# Altium project 2026_carte_LCM.PrjPcb
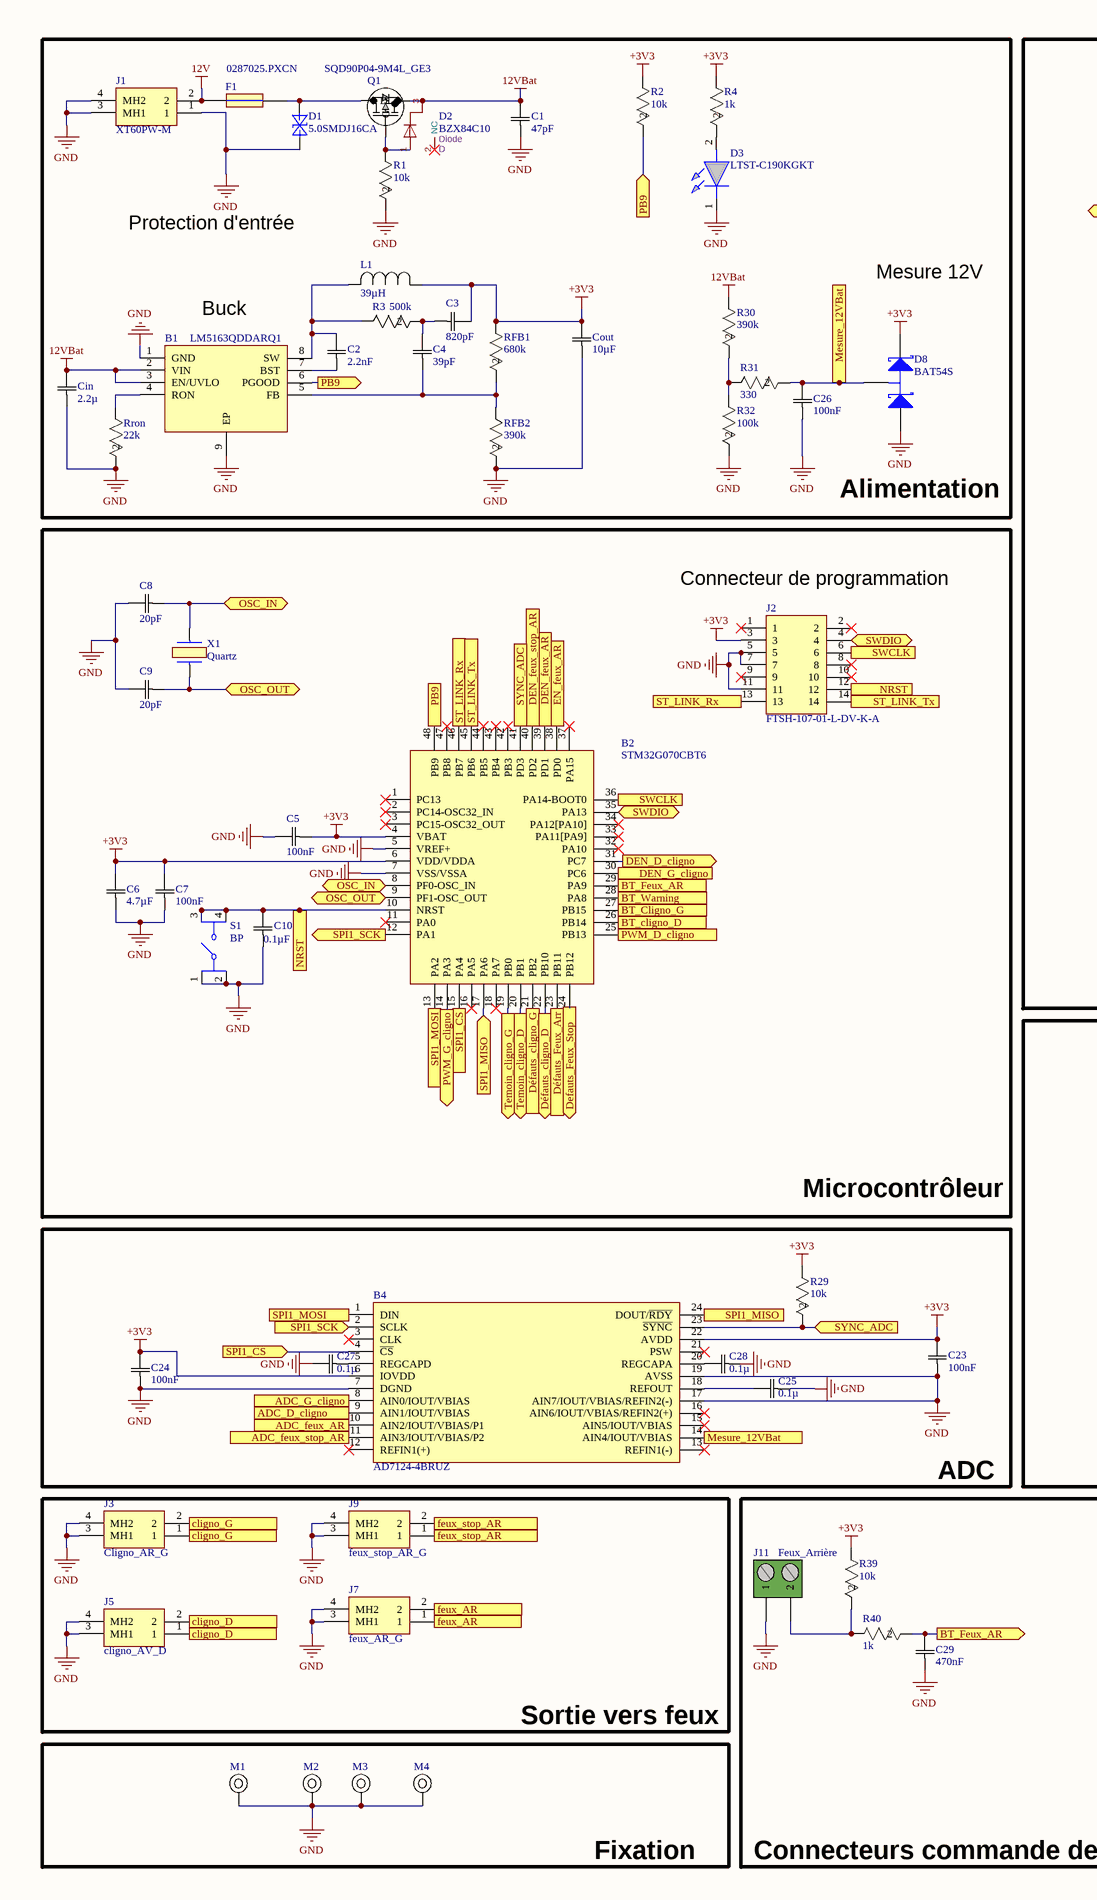
[diagram p0: LCM.SchDoc, left]
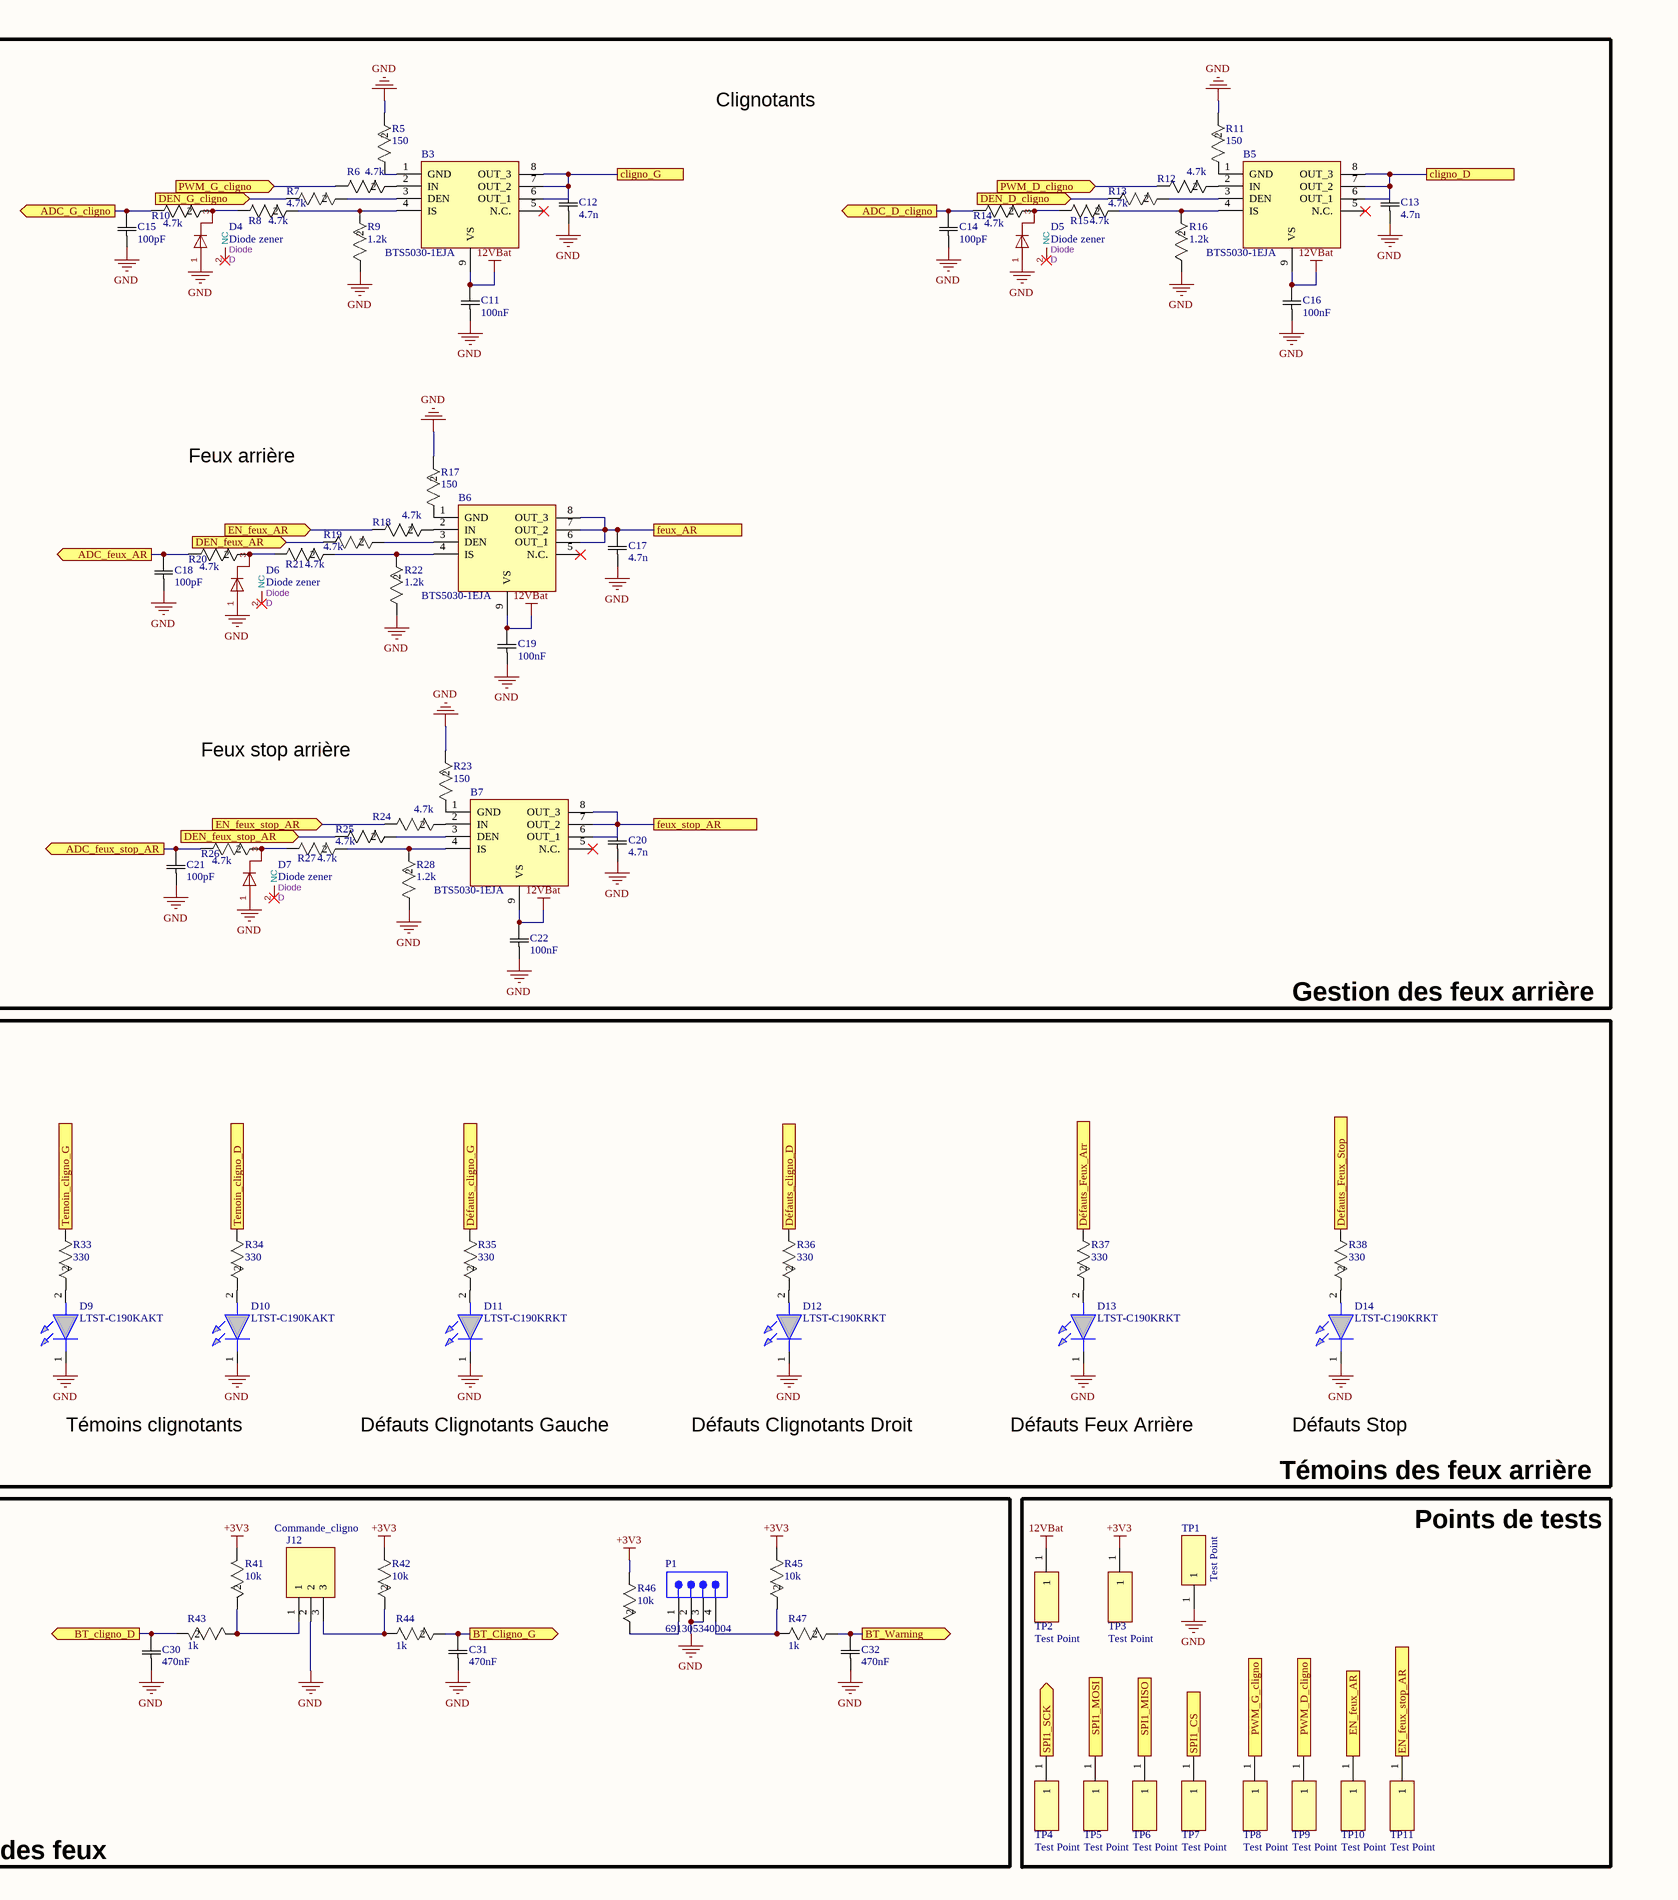
[diagram p1: LCM.SchDoc, right]
1 sheet, 134 parts. Net scope: flat (ports and power ports of the same name join across sheets).
Board file: LCM.PcbDoc

## Sheet LCM.SchDoc
size A2; SheetNumber: 1; SheetTotal: 1

### Parts
B1  LM5163QDDARQ1  [BTS5030-1EJA]
B2  STM32G070CBT6  [STM32G070CBT6]
B3  BTS5030-1EJA  [BTS5030-1EJA]
B4  AD7124-4BRUZ  [AD7124-4BRUZ]
B5  BTS5030-1EJA  [BTS5030-1EJA]
B6  BTS5030-1EJA  [BTS5030-1EJA]
B7  BTS5030-1EJA  [BTS5030-1EJA]
C1  47pF  [CAP_0603_WAL-L]
C2  2.2nF  [CAP_0603_WAL-L]
C3  820pF  [CAP_0603_WAL-L]
C4  39pF  [CAP_0603_WAL-L]
C5  100nF  [CAP_0603_WAL-L]
C6  4.7µF  [CAP_0603_WAL-L]
C7  100nF  [CAP_0603_WAL-L]
C8  20pF  [CAP_0603_WAL-L]
C9  20pF  [CAP_0603_WAL-L]
C10  0.1µF  [CAP_0603_WAL-L]
C11  100nF  [CAP_0603_WAL-L]
C12  4.7n  [CAP_0603_WAL-L]
C13  4.7n  [CAP_0603_WAL-L]
C14  100pF  [CAP_0603_WAL-L]
C15  100pF  [CAP_0603_WAL-L]
C16  100nF  [CAP_0603_WAL-L]
C17  4.7n  [CAP_0603_WAL-L]
C18  100pF  [CAP_0603_WAL-L]
C19  100nF  [CAP_0603_WAL-L]
C20  4.7n  [CAP_0603_WAL-L]
C21  100pF  [CAP_0603_WAL-L]
C22  100nF  [CAP_0603_WAL-L]
C23  100nF  [CAP_0603_WAL-L]
C24  100nF  [CAP_0603_WAL-L]
C25  0.1µ  [CAP_0603_WAL-L]
C26  100nF  [CAP_0603_WAL-L]
C27  0.1µ  [CAP_0603_WAL-L]
C28  0.1µ  [CAP_0603_WAL-L]
C29  470nF  [CAP_0603_WAL-L]
C30  470nF  [CAP_0603_WAL-L]
C31  470nF  [CAP_0603_WAL-L]
C32  470nF  [CAP_0603_WAL-L]
Cin  2.2µ  [CGA6N3X7R2A225K230AB]
Cout  10µF  [KGM21AR71A106KL]
D1  5.0SMDJ16CA  [5.0SMDJ16CA]
D2  BZX84C10  value Diode  Reference: D  [Diode zener 10V]
D3  LTST-C190KGKT  [LEDC1608X80N]
D4  Diode zener  value Diode  Reference: D  [BZX84B3V3-7-F]
D5  Diode zener  value Diode  Reference: D  [BZX84B3V3-7-F]
D6  Diode zener  value Diode  Reference: D  [BZX84B3V3-7-F]
D7  Diode zener  value Diode  Reference: D  [BZX84B3V3-7-F]
D8  BAT54S  [BAT54S]
D9  LTST-C190KAKT  [LEDC1608X80N]
D10  LTST-C190KAKT  [LEDC1608X80N]
D11  LTST-C190KRKT  [LEDC1608X80N]
D12  LTST-C190KRKT  [LEDC1608X80N]
D13  LTST-C190KRKT  [LEDC1608X80N]
D14  LTST-C190KRKT  [LEDC1608X80N]
F1  0287025.PXCN  [Porte Fusible]
J1  XT60PW-M  [XT60PWM]
J2  FTSH-107-01-L-DV-K-A  [FTSH-107-XX-YYY-DV-K-A]
J3  Cligno_AR_G  [XT60PWM]
J5  cligno_AV_D  [XT60PWM]
J7  feux_AR_G  [XT60PWM]
J9  feux_stop_AR_G  [XT60PWM]
J11  Feux_Arrière  [Connecteur_5V_Coude]
J12  Commande_cligno  [Connecteur_3V3_3pos]
L1  39µH  [CDRH5D28NP-390NC]
M1  Mounting Hole  [M3_HOLE]  (value not drawn)
M2  Mounting Hole  [M3_HOLE]  (value not drawn)
M3  Mounting Hole  [M3_HOLE]  (value not drawn)
M4  Mounting Hole  [M3_HOLE]  (value not drawn)
P1  691305340004  [Connecteur_3V3_4pos]
Q1  SQD90P04-9M4L_GE3  [Mosfet_Canal_P]
R1  10k  [Resistance 0603]
R2  10k  [Resistance 0603]
R3  500k  [Resistance 0603]
R4  1k  [Resistance 0603]
R5  150  [Resistance 0603]
R6  4.7k  [Resistance 0603]
R7  4.7k  [Resistance 0603]
R8  4.7k  [Resistance 0603]
R9  1.2k  [Resistance 0603]
R10  4.7k  [Resistance 0603]
R11  150  [Resistance 0603]
R12  4.7k  [Resistance 0603]
R13  4.7k  [Resistance 0603]
R14  4.7k  [Resistance 0603]
R15  4.7k  [Resistance 0603]
R16  1.2k  [Resistance 0603]
R17  150  [Resistance 0603]
R18  4.7k  [Resistance 0603]
R19  4.7k  [Resistance 0603]
R20  4.7k  [Resistance 0603]
R21  4.7k  [Resistance 0603]
R22  1.2k  [Resistance 0603]
R23  150  [Resistance 0603]
R24  4.7k  [Resistance 0603]
R25  4.7k  [Resistance 0603]
R26  4.7k  [Resistance 0603]
R27  4.7k  [Resistance 0603]
R28  1.2k  [Resistance 0603]
R29  10k  [Resistance 0603]
R30  390k  [Resistance 0603]
R31  330  [Resistance 0603]
R32  100k  [Resistance 0603]
R33  330  [Resistance 0603]
R34  330  [Resistance 0603]
R35  330  [Resistance 0603]
R36  330  [Resistance 0603]
R37  330  [Resistance 0603]
R38  330  [Resistance 0603]
R39  10k  [Resistance 0603]
R40  1k  [Resistance 0603]
R41  10k  [Resistance 0603]
R42  10k  [Resistance 0603]
R43  1k  [Resistance 0603]
R44  1k  [Resistance 0603]
R45  10k  [Resistance 0603]
R46  10k  [Resistance 0603]
R47  1k  [Resistance 0603]
RFB1  680k  [Resistance 0603]
RFB2  390k  [Resistance 0603]
Rron  22k  [Resistance 0603]
S1  BP  [Bouton Poussoir]
TP1  Test Point  [Test Point]
TP2  Test Point  [Test Point]
TP3  Test Point  [Test Point]
TP4  Test Point  [Test Point]
TP5  Test Point  [Test Point]
TP6  Test Point  [Test Point]
TP7  Test Point  [Test Point]
TP8  Test Point  [Test Point]
TP9  Test Point  [Test Point]
TP10  Test Point  [Test Point]
TP11  Test Point  [Test Point]
X1  Quartz  [XT9M20HRR8M]

### Blocks framed on the sheet
Alimentation: B1 C1-C4 C26 Cin Cout D1-D3 D8 F1 J1 L1 Q1 R1-R4 R30-R32 RFB1 RFB2 Rron
Gestion des feux arrière: B3 B5-B7 C11-C22 D4-D7 R5-R28
Microcontrôleur: B2 C5-C10 J2 S1 X1
ADC: B4 C23-C25 C27 C28 R29
Sortie vers feux: J3 J5 J7 J9
Connecteurs commande des feux: C29-C32 J11 J12 P1 R39-R47

### Ports
ADC_D_cligno (in, see LCM[6A]), ADC_D_cligno (out, see LCM[1C]), ADC_feux_AR (in, see LCM[4B]), ADC_feux_AR (out, see LCM[1C]), ADC_feux_stop_AR (in, see LCM[4B]), ADC_feux_stop_AR (out, see LCM[1D]), ADC_G_cligno (in, see LCM[4A]), ADC_G_cligno (out, see LCM[1C]), BT_cligno_D (in, see LCM[4D]), BT_cligno_D (out, see LCM[2B]), BT_Cligno_G (in, see LCM[5D]), BT_Cligno_G (out, see LCM[2B]), BT_Feux_AR (in, see LCM[3D]), BT_Feux_AR (out, see LCM[2B]), BT_Warning (in, see LCM[6D]), BT_Warning (out, see LCM[2B]), cligno_D (see LCM[1D]), cligno_D (see LCM[1D], LCM[8A]), cligno_G (see LCM[1D]), cligno_G (see LCM[1D], LCM[5A]), Defauts_Feux_Stop (in, see LCM[2C]), Defauts_Feux_Stop (out, see LCM[8C]), DEN_D_cligno (in, see LCM[2B]), DEN_D_cligno (out, see LCM[7A]), DEN_feux_AR (in, see LCM[2B]), DEN_feux_AR (out, see LCM[4B]), DEN_feux_stop_AR (in, see LCM[2B]), DEN_feux_stop_AR (out, see LCM[4B]), DEN_G_cligno (in, see LCM[2B]), DEN_G_cligno (out, see LCM[4A]), Défauts_cligno_D (in, see LCM[2C]), Défauts_cligno_D (out, see LCM[6C]), Défauts_cligno_G (in, see LCM[2C]), Défauts_cligno_G (out, see LCM[5C]), Défauts_Feux_Arr (in, see LCM[2C]), Défauts_Feux_Arr (out, see LCM[7C]), EN_feux_AR (in, see LCM[2B], LCM[8D]), EN_feux_AR (out, see LCM[2B], LCM[4B]), EN_feux_AR (out, see LCM[4B], LCM[8D]), EN_feux_stop_AR (in, see LCM[8D]), EN_feux_stop_AR (out, see LCM[4B]), feux_AR (see LCM[2D]), feux_AR (see LCM[2D], LCM[6B]), feux_stop_AR (see LCM[2D]), feux_stop_AR (see LCM[2D], LCM[6B]), Mesure_12VBat (in, see LCM[3A]), Mesure_12VBat (out, see LCM[3D]), NRST (in, see LCM[3B]), NRST (out, see LCM[1C]), OSC_IN (bidir, see LCM[1B]), OSC_OUT (bidir, see LCM[1B]), PB9 (in, see LCM[1A], LCM[2B]), PB9 (out, see LCM[1A], LCM[2A]), PB9 (out, see LCM[2A], LCM[2B]), PWM_D_cligno (in, see LCM[2B], LCM[7D]), PWM_D_cligno (out, see LCM[2B], LCM[7A]), PWM_D_cligno (out, see LCM[7A], LCM[7D]), PWM_G_cligno (in, see LCM[2C], LCM[7D]), PWM_G_cligno (out, see LCM[2C], LCM[4A]), PWM_G_cligno (out, see LCM[4A], LCM[7D]), SPI1_CS (in, see LCM[2C], LCM[7D]), SPI1_CS (out, see LCM[1C], LCM[2C]), SPI1_CS (out, see LCM[1C], LCM[7D]), SPI1_MISO (in, see LCM[3C], LCM[7D]), SPI1_MISO (out, see LCM[2C], LCM[3C]), SPI1_MISO (out, see LCM[2C], LCM[7D]), SPI1_MOSI (in, see LCM[2C], LCM[7D]), SPI1_MOSI (out, see LCM[1C], LCM[2C]), SPI1_MOSI (out, see LCM[1C], LCM[7D]), SPI1_SCK (in, see LCM[1B], LCM[7D]), SPI1_SCK (out, see LCM[1B], LCM[1C]), SPI1_SCK (out, see LCM[1C], LCM[7D]), ST_LINK_Rx (in, see LCM[2B]), ST_LINK_Rx (out, see LCM[2B]), ST_LINK_Tx (in, see LCM[3B]), ST_LINK_Tx (out, see LCM[2B]), SWCLK (in, see LCM[3B]), SWCLK (out, see LCM[2B]), SWDIO (bidir, see LCM[2B]), SWDIO (bidir, see LCM[3B]), SYNC_ADC (in, see LCM[2B]), SYNC_ADC (out, see LCM[3C]), Temoin_cligno_D (in, see LCM[2C]), Temoin_cligno_D (out, see LCM[4C]), Temoin_cligno_G (in, see LCM[2C]), Temoin_cligno_G (out, see LCM[4C])

### Nets
12V: F1.1 J1.2
12VBat: B1.2(VIN) B1.3(EN/UVLO) B3.9(VS) B5.9(VS) B6.9(VS) B7.9(VS) C1.2 C11.2 C16.2 C19.2 C22.2 Cin.2 D2.3(K) Q1.3(S) R30.1 TP2.1
+3V3: B2.4(VBAT) B2.6(VDD/VDDA) B4.6(IOVDD) B4.22(AVDD) C3.2 C5.1 C6.2 C7.2 C23.2 C24.2 Cout.2 D8.2(K) J2.3 L1.1 R2.1 R4.1 R29.1 R39.1 R41.1 R42.1 R45.1 R46.1 RFB1.1 TP3.1
GND: B1.1(GND) B1.9(EP) B2.5(VREF+) B2.7(VSS/VSSA) B4.7(DGND) B4.17(AIN7/IOUT/VBIAS/REFIN2(-)) B4.19(AVSS) C1.1 C5.2 C6.1 C7.1 C8.2 C9.2 C10.1 C11.1 C12.1 C13.1 C14.1 C15.1 C16.1 C17.1 C18.1 C19.1 C20.1 C21.1 C22.1 C23.1 C24.1 C25.1 C26.1 C27.2 C28.1 C29.1 C30.1 C31.1 C32.1 Cin.1 Cout.1 D1.1 D3.1(K) D4.1(A) D5.1(A) D6.1(A) D7.1(A) D8.1(A) D9.1(K) D10.1(K) D11.1(K) D12.1(K) D13.1(K) D14.1(K) J1.1 J1.3(MH1) J1.4(MH2) J2.5 J2.7 J2.11 J3.3(MH1) J3.4(MH2) J5.3(MH1) J5.4(MH2) J7.3(MH1) J7.4(MH2) J9.3(MH1) J9.4(MH2) J11.1 J12.2 M1.1 M2.1 M3.1 M4.1 P1.2 P1.3 R1.2 R5.2 R9.1 R11.2 R16.1 R17.2 R22.1 R23.2 R28.1 R32.2 RFB2.2 Rron.2 S1.1(COM_1) S1.2(COM_2) TP1.1
ADC_D_cligno: B4.9(AIN1/IOUT/VBIAS) C14.2 R14.1 ; port ADC_D_cligno
ADC_feux_AR: B4.10(AIN2/IOUT/VBIAS/P1) C18.2 R20.1 ; port ADC_feux_AR
ADC_feux_stop_AR: B4.11(AIN3/IOUT/VBIAS/P2) C21.2 R26.1 ; port ADC_feux_stop_AR
ADC_G_cligno: B4.8(AIN0/IOUT/VBIAS) C15.2 R10.1 ; port ADC_G_cligno
BT_cligno_D: B2.26(PB14) C30.2 R43.2 ; port BT_cligno_D
BT_Cligno_G: B2.27(PB15) C31.2 R44.2 ; port BT_Cligno_G
BT_Feux_AR: B2.29(PA9) C29.2 R40.2 ; port BT_Feux_AR
BT_Warning: B2.28(PA8) C32.2 R47.2 ; port BT_Warning
cligno_D: B5.6(OUT_1) B5.7(OUT_2) B5.8(OUT_3) C13.2 J5.1 J5.2 ; port cligno_D
cligno_G: B3.6(OUT_1) B3.7(OUT_2) B3.8(OUT_3) C12.2 J3.1 J3.2 ; port cligno_G
Defauts_Feux_Stop: B2.24(PB12) R38.1 ; port Defauts_Feux_Stop
DEN_D_cligno: B2.31(PC7) R13.1 ; port DEN_D_cligno
DEN_feux_AR: B2.39(PD1) R19.1 ; port DEN_feux_AR
DEN_feux_stop_AR: B2.40(PD2) R25.1 ; port DEN_feux_stop_AR
DEN_G_cligno: B2.30(PC6) R7.1 ; port DEN_G_cligno
Défauts_cligno_D: B2.22(PB10) R36.1 ; port Défauts_cligno_D
Défauts_cligno_G: B2.21(PB2) R35.1 ; port Défauts_cligno_G
Défauts_Feux_Arr: B2.23(PB11) R37.1 ; port Défauts_Feux_Arr
EN_feux_AR: B2.38(PD0) R18.1 TP10.1 ; port EN_feux_AR
EN_feux_stop_AR: R24.1 TP11.1 ; port EN_feux_stop_AR
feux_AR: B6.6(OUT_1) B6.7(OUT_2) B6.8(OUT_3) C17.2 J7.1 J7.2 ; port feux_AR
feux_stop_AR: B7.6(OUT_1) B7.7(OUT_2) B7.8(OUT_3) C20.2 J9.1 J9.2 ; port feux_stop_AR
Mesure_12VBat: B4.14(AIN4/IOUT/VBIAS) C26.2 D8.3(C) R31.2 ; port Mesure_12VBat
NRST: B2.10(NRST) C10.2 J2.12 S1.3(NO_1) S1.4(NO_2) ; port NRST
OSC_IN: B2.8(PF0-OSC_IN) C8.1 X1.2 ; port OSC_IN
OSC_OUT: B2.9(PF1-OSC_OUT) C9.1 X1.1 ; port OSC_OUT
PB9: B1.6(PGOOD) B2.48(PB9) R2.2 ; port PB9
PWM_D_cligno: B2.25(PB13) R12.1 TP9.1 ; port PWM_D_cligno
PWM_G_cligno: B2.14(PA3) R6.1 TP8.1 ; port PWM_G_cligno
SPI1_CS: B2.15(PA4) B4.4(~{CS}) TP7.1 ; port SPI1_CS
SPI1_MISO: B2.17(PA6) B4.24(DOUT/~{RDY}) TP6.1 ; port SPI1_MISO
SPI1_MOSI: B2.13(PA2) B4.1(DIN) TP5.1 ; port SPI1_MOSI
SPI1_SCK: B2.12(PA1) B4.2(SCLK) TP4.1 ; port SPI1_SCK
ST_LINK_Rx: B2.46(PB7) J2.13 ; port ST_LINK_Rx
ST_LINK_Tx: B2.45(PB6) J2.14 ; port ST_LINK_Tx
SWCLK: B2.36(PA14-BOOT0) J2.6 ; port SWCLK
SWDIO: B2.35(PA13) J2.4 ; port SWDIO
SYNC_ADC: B2.41(PD3) B4.23(~{SYNC}) R29.2 ; port SYNC_ADC
Temoin_cligno_D: B2.20(PB1) R34.1 ; port Temoin_cligno_D
Temoin_cligno_G: B2.19(PB0) R33.1 ; port Temoin_cligno_G
NetB1_4: B1.4(RON) Rron.1
NetB1_5: B1.5(FB) C4.1 RFB1.2 RFB2.1
NetB1_7: B1.7(BST) C2.1
NetB1_8: B1.8(SW) C2.2 L1.2 R3.1
NetB3_1: B3.1(GND) R5.1
NetB3_2: B3.2(IN) R6.2
NetB3_3: B3.3(DEN) R7.2
NetB3_4: B3.4(IS) R8.2 R9.2
NetB4_5: B4.5(REGCAPD) C27.1
NetB4_18: B4.18(REFOUT) C25.2
NetB4_20: B4.20(REGCAPA) C28.2
NetB5_1: B5.1(GND) R11.1
NetB5_2: B5.2(IN) R12.2
NetB5_3: B5.3(DEN) R13.2
NetB5_4: B5.4(IS) R15.2 R16.2
NetB6_1: B6.1(GND) R17.1
NetB6_2: B6.2(IN) R18.2
NetB6_3: B6.3(DEN) R19.2
NetB6_4: B6.4(IS) R21.2 R22.2
NetB7_1: B7.1(GND) R23.1
NetB7_2: B7.2(IN) R24.2
NetB7_3: B7.3(DEN) R25.2
NetB7_4: B7.4(IS) R27.2 R28.2
NetC3_1: C3.1 C4.2 R3.2
NetD1_2: D1.2 F1.2 Q1.4(D)
NetD2_1: D2.1(A) Q1.1(G) R1.1
NetD3_2: D3.2(A) R4.2
NetD4_3: D4.3(K) R8.1 R10.2
NetD5_3: D5.3(K) R14.2 R15.1
NetD6_3: D6.3(K) R20.2 R21.1
NetD7_3: D7.3(K) R26.2 R27.1
NetD9_2: D9.2(A) R33.2
NetD10_2: D10.2(A) R34.2
NetD11_2: D11.2(A) R35.2
NetD12_2: D12.2(A) R36.2
NetD13_2: D13.2(A) R37.2
NetD14_2: D14.2(A) R38.2
NetJ11_2: J11.2 R39.2 R40.1
NetJ12_1: J12.1 R41.2 R43.1
NetJ12_3: J12.3 R42.2 R44.1
NetP1_1: P1.1 R46.2
NetP1_4: P1.4 R45.2 R47.1
NetR30_2: R30.2 R31.1 R32.1

Not connected (* = marked no-connect by the designer): B2 1(PC13)* 2(PC14-OSC32_IN)* 3(PC15-OSC32_OUT)* 11(PA0)* 16(PA5)* 18(PA7)* 32(PA10)* 33(PA11[PA9])* 34(PA12[PA10])* 37(PA15)* 42(PB3)* 43(PB4)* 44(PB5)* 47(PB8)*; B3 5(N.C.)*; B4 3(CLK)* 12(REFIN1(+))* 13(REFIN1(-))* 15(AIN5/IOUT/VBIAS)* 16(AIN6/IOUT/VBIAS/REFIN2(+))* 21(PSW)*; B5 5(N.C.)*; B6 5(N.C.)*; B7 5(N.C.)*; D2 2(NC)*; D4 2(NC)*; D5 2(NC)*; D6 2(NC)*; D7 2(NC)*; J2 1* 2* 8* 9* 10*

### Notes on the sheet
- Clignotants
- Protection d'entrée
- Mesure 12V
- (near B1) Buck
- Feux arrière
- (near J2) Connecteur de programmation
- Feux stop arrière
- Témoins clignotants
- Défauts Clignotants Gauche
- Défauts Clignotants Droit
- Défauts Feux Arrière
- Défauts Stop
- Témoins des feux arrière
- Points de tests
- Fixation

### Library data of the parts
B1 = LM5163QDDARQ1: 100-V input, 0.5-A synchronous buck DC/DC converter with ultra-low IQ; Manufacturer_Name: Texas Instruments; Geometry.Height: 1.7mm; Mouser Part Number: 595-LM5163QDDARQ1; Mouser Price/Stock: https://www.mouser.co.uk/ProductDetail/Texas-Instruments/LM5163QDDARQ1?qs=mAH9sUMRCtv%252Bp97Xz%2FAX6Q%3D%3D; Manufacturer_Part_Number: LM5163QDDARQ1; Datasheet Link: http://www.ti.com/lit/gpn/LM5163-Q1
B2 = STM32G070CBT6: ARM Microcontrollers - MCU Arm Cortex -M0+ 32-bit MCU, 128 KB Flash, 36 KB RAM, 4x USART, timers, ADC, comm. I/Fs, 2.0-3.6V; Manufacturer_Name: STMicroelectronics; Geometry.Height: 1.6mm; Mouser Part Number: 511-STM32G070CBT6; Mouser Price/Stock: https://www.mouser.co.uk/ProductDetail/STMicroelectronics/STM32G070CBT6?qs=l7cgNqFNU1gFKn1as7Ms0g%3D%3D; Manufacturer_Part_Number: STM32G070CBT6; Datasheet Link: https://www.st.com/resource/en/datasheet/stm32g070cb.pdf
B3 B5-B7 = BTS5030-1EJA: Power Switch ICs - Power Distribution Profet Smart High Side Switch 28V 36A; Manufacturer_Name: Infineon; Geometry.Height: 1.7mm; Mouser Part Number: 726-BTS5030-1EJA; Mouser Price/Stock: https://www.mouser.co.uk/ProductDetail/Infineon-Technologies/BTS5030-1EJA?qs=%252BWnEOWq1JvHis1YUcAvI1A%3D%3D; Manufacturer_Part_Number: BTS5030-1EJA; Datasheet Link: https://ms.componentsearchengine.com/Datasheets/1/BTS5030-1EJA.pdf
B4 = AD7124-4BRUZ: 4-Channel, Low Noise, Low Power, 24-Bit, Sigma-Delta ADC with PGA and Reference; Manufacturer_Name: Analog Devices; Geometry.Height: 1.2mm; Mouser Part Number: 584-AD7124-4BRUZ; Mouser Price/Stock: https://www.mouser.co.uk/ProductDetail/Analog-Devices/AD7124-4BRUZ?qs=8Sj0zgMuDMVqCrsELALuFg%3D%3D; Manufacturer_Part_Number: AD7124-4BRUZ; Datasheet Link: http://www.analog.com/media/en/technical-documentation/data-sheets/AD7124-4.pdf
C1 C5-C32 = Capa: No Description Available; Manufacturer_Name: Walsin; Manufacturer_Part_Number: 0603N200J500CT; Copyright: Copyright (C) 2026 Ultra Librarian. All rights reserved.
C2 = Capa: GCM188R71H222KA37D; Manufacturer_Name: Walsin; Manufacturer_Part_Number: 0603N200J500CT; Copyright: Copyright (C) 2026 Ultra Librarian. All rights reserved.
C3 = Capa: CGA3E2C0G1H821J080AA; Manufacturer_Name: Walsin; Manufacturer_Part_Number: 0603N200J500CT; Copyright: Copyright (C) 2026 Ultra Librarian. All rights reserved.
C4 = Capa: C0603C390J5GACTU; Manufacturer_Name: Walsin; Manufacturer_Part_Number: 0603N200J500CT; Copyright: Copyright (C) 2026 Ultra Librarian. All rights reserved.
Cin = Capa: CGA6N3X7R2A225K230AB; Manufacturer_Name: Walsin; Manufacturer_Part_Number: 0603N200J500CT; Copyright: Copyright (C) 2026 Ultra Librarian. All rights reserved.
Cout = Capa: KGM21AR71A106KL; Manufacturer_Name: Walsin; Manufacturer_Part_Number: 0603N200J500CT; Copyright: Copyright (C) 2026 Ultra Librarian. All rights reserved.
D1 = 5.0SMDJ16CA: 26V Clamp 193A Ipp Tvs Diode Surface Mount DO-214AB (SMCJ); MF: Littelfuse; SnapEDA_Link: https://www.snapeda.com/parts/5.0SMDJ16CA/Littelfuse/view-part/?ref=snap; Package: DO-214 Littelfuse Inc.; Value: *; MP: 5.0SMDJ16CA; Check_prices: https://www.snapeda.com/parts/5.0SMDJ16CA/Littelfuse/view-part/?ref=eda
D2 = BZX84C10: Diode zener 10V; ki_keywords: Doide NC pin; ki_description: Diode with NC pin; Datasheet: https://diotec.com/de/produktliste/D.html
D3 = LED: Lite-On LTST-C190KGKT, 571 nm Green LED, 1608 (0603) SMD package; Geometry.Height: 0.8mm; Mouser Part Number: 859-LTST-C190KGKT; Mouser Price/Stock: https://www.mouser.co.uk/ProductDetail/Lite-On/LTST-C190KGKT?qs=205qCy6M2Q%252BAdcgwUZktqw%3D%3D; Manufacturer_Name: Lite-On; Manufacturer_Part_Number: LTST-C190KGKT; Datasheet Link: *
D4-D7 = Diode zener: ki_keywords: Doide NC pin; ki_description: Diode with NC pin; Datasheet: https://diotec.com/de/produktliste/D.html
D8 = Diode Shottky double BAT54S: DIODE SCHOTTKY DOUBLE; Manufacturer: ZETEX; ComponentLink1URL: http://www.farnell.com/datasheets/27632.pdf; ComponentLink1Description: http://www.farnell.com/datasheets/27632.pdf; Supplier: Farnell; RoHS: YES; Supplier Part Number: 9526510; Pricing: 5=0,32, 25=0,26, 100=0,21, 1000=0,17 (EUR); Manufacturer Part Number: BAT54S
D9 D10 = LED: Lite-On LTST-C190KAKT, 571 nm Orange LED, 1608 (0603) SMD package; Manufacturer_Part_Number: LTST-C190KGKT; Geometry.Height: 0.8mm; Mouser Part Number: 859-LTST-C190KGKT; Mouser Price/Stock: https://www.mouser.co.uk/ProductDetail/Lite-On/LTST-C190KGKT?qs=205qCy6M2Q%252BAdcgwUZktqw%3D%3D; Manufacturer_Name: Lite-On; Datasheet Link: *
D11-D14 = LED: Lite-On LTST-C190KRKT 571 nm RED LED, 1608 (0603) SMD package; Manufacturer_Part_Number: LTST-C190KGKT; Geometry.Height: 0.8mm; Mouser Part Number: 859-LTST-C190KGKT; Mouser Price/Stock: https://www.mouser.co.uk/ProductDetail/Lite-On/LTST-C190KGKT?qs=205qCy6M2Q%252BAdcgwUZktqw%3D%3D; Manufacturer_Name: Lite-On; Datasheet Link: *
F1 = Fuse: Clear ATOF F Fuse 25A 32V; Manufacturer_Name: LITTELFUSE; Geometry.Height: 12.3mm; Mouser Part Number: 576-0287025.PXCN; Mouser Price/Stock: https://www.mouser.co.uk/ProductDetail/Littelfuse/0287025.PXCN?qs=Vv6sT79n3zTQ3ExP8aVIIA%3D%3D; Manufacturer_Part_Number: 0287025.PXCN; Datasheet Link: https://www.littelfuse.com/~/media/automotive/datasheets/fuses/passenger-car-and-commercial-vehicle/blade-fuses/littelfuse_atof_datasheet.pdf
J1 J3 J5 J7 J9 = XT60PW-M: Connector; Manufacturer_Name: Amass; Datasheet Link: https://www.tme.eu/Document/b13629717d44ae038681dba08d18c0b6/XT60PW-M.pdf; Height: 8.4mm; Manufacturer_Part_Number: XT60PW-M
J2 = FTSH-107-01-L-DV-K-A: Connecteur de programmation; Manufacturer_Name: SAMTEC; Datasheet Link: http://suddendocs.samtec.com/prints/ftsh-1xx-xx-xxx-dv-xxx-xxx-mkt.pdf; Manufacturer_Part_Number: FTSH-107-01-L-DV-K-A; Mouser Part Number: 200-FTSH10701LDVKA; Mouser Price/Stock: https://www.mouser.co.uk/ProductDetail/Samtec/FTSH-107-01-L-DV-K-A?qs=PB6%2FjmICvI3xEHFou4PhNg%3D%3D; Arrow Part Number: FTSH-107-01-L-DV-K-A; Arrow Price/Stock: https://www.arrow.com/en/products/ftsh-107-01-l-dv-k-a/samtec.html?utm_currency=USD&region=nac
J11 = Connecteur_5V
J12 = Connecteur_3V3_3_pos: WR-TBL Terminal block - PCB Header - THT Serie 3053 - 3,81mm pitch - Monoblock THT - Green - Horizontal PCB Header with Plastic ears 03p; Manufacturer_Name: Wurth Elektronik; Manufacturer_Part_Number: 691305340003; Geometry.Height: 7.5mm; Mouser Part Number: 710-691305340003; Mouser Price/Stock: https://www.mouser.co.uk/ProductDetail/Wurth-Elektronik/691305340003?qs=lBTPRtX1sU90CHy4WHMybg%3D%3D; Datasheet Link: https://www.digikey.com/en/products/detail/w%C3%BCrth-elektronik/691305340003/6644174
L1 = Inductance: Description; Manufacturer_Name: Sumida; Manufacturer_Part_Number: CDRH5D28NP-100NC; Copyright: Copyright (C) 2025 Ultra Librarian. All rights reserved.
P1 = Connecteur_3V3_4pos: WR-TBL Series 3053 Horizontal PCB Header, THT, pitch 3.81mm, 04p; Manufacturer: Wurth Elektronik; Modularity: No; Rated Current: 12A; Working Voltage: 300V (AC); Manufacturer Part Number: 691305340004; Product Series: WR-TBL; ComponentLink1Description: Website Link; ComponentLink1URL: https://www.we-online.com; ComponentLink2Description: Datasheet Link; ComponentLink2URL: https://www.we-online.com/components/products/datasheet/691305340004; Mount: Through Hole; Operating Temperature Min: -40degC; Operating Temperature Max: 105degC; Packaging: Box; Application: Pluggable; Number of Pins: 4; Number of Rows: 1; Orientation: Horizontal; Lead Pitch: 3.81mm
Q1 = Mosfet Canal P: P-CHANNEL 40-V (D-S) 175C MOSFET; Manufacturer_Name: Vishay; Type: Transistors; Copyright: Copyright (C) 2026 Ultra Librarian. All rights reserved.; Manufacturer_Part_Number: SQD90P04-9M4L_GE3; Datasheet: https://www.vishay.com/doc?66743
R1 R2 R4 R5 R9 R11 R16 R17 R22 R23 R28 R29 R33-R38 = Résistance: CPF 0603 100K 0.1% 25PPM 5K RL; Manufacturer_Name: TE Connectivity; Manufacturer_Part_Number: CPF0603B100KE; Copyright: Copyright (C) 2026 Ultra Librarian. All rights reserved.
R3 R6-R8 R10 R12-R15 R18-R21 R24-R27 R30-R32 R39-R47 RFB1 RFB2 Rron = Résistance: Manufacturer_Name: TE Connectivity; Manufacturer_Part_Number: CPF0603B100KE; Copyright: Copyright (C) 2026 Ultra Librarian. All rights reserved.
S1 = BP: Switch (4-Pin Push); Manufacturer_Name: Same Sky; Manufacturer_Part_Number: TS40-66-33-BK-260-SMT-TR; Datasheet Link: https://www.sameskydevices.com/product/resource/ts40.pdf; Height: 3.4mm
TP1-TP11 = Test Point: Test Point Keystone Electronics 5001; Manufacturer_Part_Number: 5001; Datasheet Link: http://www.keyelco.com/product-pdf.cfm?p=1310; Manufacturer_Name: Keystone Electronics; Mouser Part Number: 534-5001; Mouser Price/Stock: https://www.mouser.co.uk/ProductDetail/Keystone-Electronics/5001?qs=q0tsjPZWdm%2FW0vdr%2FwowKg%3D%3D; Arrow Part Number: 5001; Arrow Price/Stock: https://www.arrow.com/en/products/5001/keystone-electronics.html?utm_currency=USD&region=europe
X1 = Quartz: Low Profile SMD Type Crystal Units; Manufacturer_Name: Vishay; Geometry.Height: 4.5mm; Mouser Part Number: 70-XT49MR-208MHZTR; Mouser Price/Stock: https://www.mouser.co.uk/ProductDetail/Vishay-Dale/XT9M20HRR8M?qs=n2tc7qt3lsa%252BUGKkvhaCdg%3D%3D; Manufacturer_Part_Number: XT9M20HRR8M; Datasheet Link: https://www.vishay.com/docs/35012/xt49m.pdf